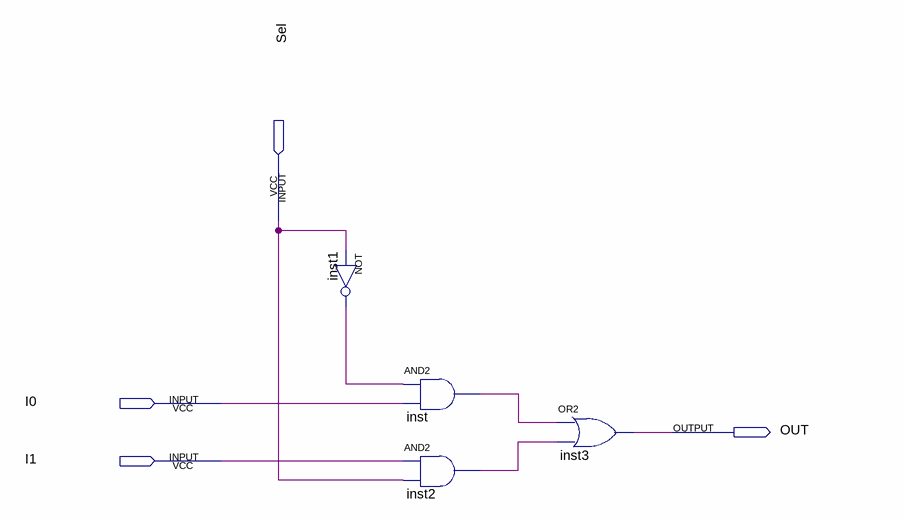
[diagram p0: schematic sheet]
// Quartus schematic MUX2TO1.bdf as structural Verilog: 4 symbols, 4 pins
module MUX2TO1 (
  input  Sel,
  input  I0,
  input  I1,
  output OUT
);

  wire inst1_out, inst2_out, inst_out;

  not inst1 (inst1_out, Sel);
  and inst (inst_out, inst1_out, I0);
  and inst2 (inst2_out, I1, Sel);
  or inst3 (OUT, inst_out, inst2_out);
endmodule
